# EasyEDA Pro project 辅助电源.epro, board PCB11
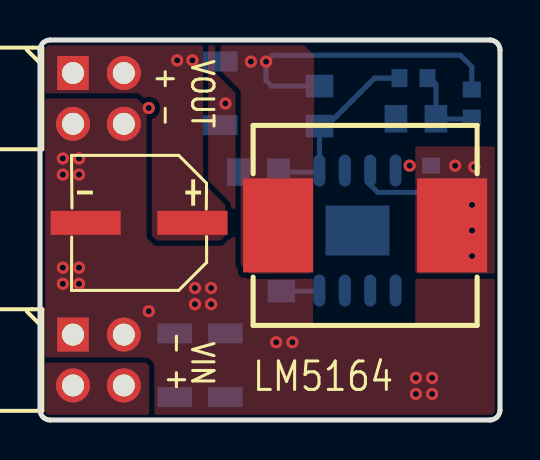
[diagram p3: board, top side]
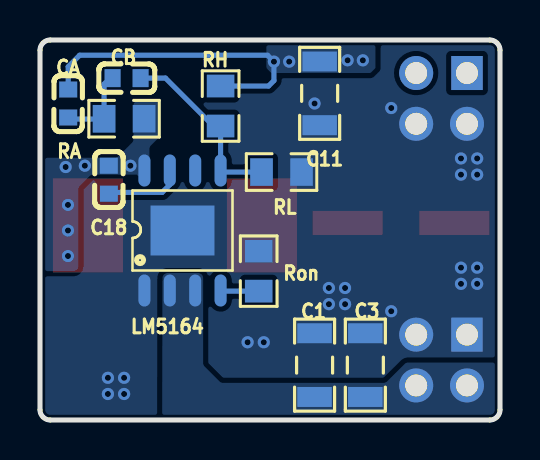
[diagram p4: board, bottom side, seen from below]

Outline 23 x 19 mm; copper layers: Top Layer, Bottom Layer. Coordinates in mm from the lower left corner of the outline.
Outline path: 0,18.49 0,0.51 arc(0.15,0.15) 0.51,0 22.49,0 arc(22.85,0.15) 23,0.51 23,18.49 arc(22.85,18.85) 22.49,19 0.51,19 arc(0.15,18.85) 0,18.49
Stack: Top Layer 0.035mm / Dielectric1 1.51mm FR4 er 4.5 / Bottom Layer 0.035mm

## Design rules (mm)
spacing copperThickness1oz (default): track to track 0.102, other pairs 0.152 to 0.3
spacing copperThickness2oz: track to track 0.203, other pairs 0.152 to 0.3
spacing Plane_innerPlane: track to track 0.102, other pairs 0.152 to 0.3
spacing Copper_copperRegion: track to track 0.102, other pairs 0.152 to 0.3
track width copperThickness1oz (default): min 0.127, default 0.254, max 2.54
track width copperThickness2oz: min 0.203, default 0.254, max 2.54
differential pair differentialPair (default): width min 0.127, default 0.254, max 2.54; gap min 0.152, default 0.152
net VOUT uses copperRegion_copperThickness1oz
pour e30 uses Copper_copperRegion, copperRegion_Copper_copperRegion
pour e32 uses Copper_copperRegion, copperRegion_Copper_copperRegion
pour e34 uses Copper_copperRegion, copperRegion_Copper_copperRegion
pour e36 uses Copper_copperRegion, copperRegion_Copper_copperRegion
pour e38 uses Copper_copperRegion, copperRegion_Copper_copperRegion
pour e106 uses Copper_copperRegion, copperRegion_Copper_copperRegion
pour e109 uses Copper_copperRegion, copperRegion_Copper_copperRegion
pour e113 uses Copper_copperRegion, copperRegion_Copper_copperRegion
pour e115 uses Copper_copperRegion, copperRegion_Copper_copperRegion

## Placement (name value [footprint] x y rotation side)
C1  10u  [C1206]  9.27 2.74 270 bottom
C2  47uF  [CAP-SMD_BD6.3-L6.6-W6.6-LS7.3-FD]  4.95 9.86 180 top
C3  100nf  [C1206]  6.73 2.74 270 bottom
C11  100nf  [C1206]  9.02 16.33 90 bottom
C18  2.2nF  [C0603]  19.56 12.02 270 bottom
CA  2.2nF  [C0603]  21.59 15.82 90 bottom
CB  10pF  [C0603]  18.67 17.09 0 bottom
J1  HX PZ2.54-2x2P WC-A  [HDR-TH_4P-P2.54-H-M-R2-C2-S2.54-W10.0]  2.92 3 270 top
J2  HX PZ2.54-2x2P WC-A  [HDR-TH_4P-P2.54-H-M-R2-C2-S2.54-W10.0]  2.92 16.08 270 top
LM5164  LM5164DDAR  [SO-8_L4.9-W3.9-P1.27-LS6.0-BL-EP]  15.88 9.47 180 bottom
RA  560K  [R0805]  18.8 15.06 180 bottom
RH  180K  [R0805]  13.97 15.7 90 bottom
RL  20K  [R0805]  10.92 12.4 0 bottom
Ron  100K  [R0805]  12.06 7.44 270 bottom
U1  47uH  [IND-SMD_L11.0-W10.2]  16.26 9.73 180 top

## Footprints (pads in the part's own frame, mm; a bottom-side part is the same pattern mirrored in y, then rotated)
C0603
  rect 0.8x0.9 smd: 1(-0.7,0) 2(0.7,0)
C1206
  rect 1x1.728 smd: 1(-1.593,0) 2(1.593,0)
CAP-SMD_BD6.3-L6.6-W6.6-LS7.3-FD
  rect 3.5x1.2 smd: 1(-2.67,0) 2(2.67,0)
HDR-TH_4P-P2.54-H-M-R2-C2-S2.54-W10.0
  rect 1.7x1.575 hole 1.1: 1(-1.27,-1.27)
  round 1.7 hole 1.1: 2(-1.27,1.27) 3(1.27,-1.27) 4(1.27,1.27)
IND-SMD_L11.0-W10.2
  rect 3.5x4.7 smd: 1(-4.35,0) 2(4.35,0)
R0805
  rect 1.133x1.377 smd: 1(-1,0) 2(1,0)
SO-8_L4.9-W3.9-P1.27-LS6.0-BL-EP
  oval 0.6x1.6 smd: 1(-1.905,-3) 2(-0.635,-3) 3(0.635,-3) 4(1.905,-3) 5(1.905,3) 6(0.635,3) 7(-0.635,3) 8(-1.905,3)
  rect 3.2x2.5 smd: 9(0,0)

## Nets
As in the schematic.

Pads without a net: LM5164 6

## Via types
v1: diameter 0.61, hole 0.305, Top Layer to Bottom Layer, 31 vias

## Routing (per net, layer and track width the routed paths; a pad name or vN(x,y) marks a point on that pad's centre or on a via; arc(x,y) is an arc through that point)
GND:
  vias: v1(1.14,13.08) v1(1.14,12.27) v1(1.14,7.62) v1(1.14,6.81) v1(1.95,13.08) v1(1.95,12.27) v1(1.95,7.62) v1(1.95,6.81) v1(5.44,15.6) v1(5.44,5.44) v1(7.75,6.6) v1(7.75,5.79) v1(8.56,6.6) v1(8.56,5.79) v1(9.27,15.82) v1(11.81,3.89) v1(12.62,3.89) v1(18.8,2.11) v1(18.8,1.3) v1(19.6,2.11) v1(19.6,1.3)
VOUT: length 15.5
  Bottom Layer w0.254: RH.2 11.57,16.7 11.3,16.97 v1(11.3,17.92) 11.62,18.24 21.02,18.24 21.59,17.66 CA.2
  vias: v1(6.86,17.98) v1(7.62,17.98) v1(10.54,17.92)
$1N503: length 1.9
  Bottom Layer w0.254: Ron.2 13.94,6.44 LM5164.4
$1N505: length 9.3
  Bottom Layer w0.254: RL.2 13.89,12.4 LM5164.5 RH.1 14.33,14.7 16.73,17.09 17.84,17.09 17.97,17.22
$1N506: length 3.9
  Bottom Layer w0.254: LM5164.7 16.51,11.76 16.89,11.38 19.49,11.38 C18.2
$1N507:
  vias: v1(18.48,12.71) v1(20.76,12.71) v1(21.6,10.75) v1(21.6,9.48) v1(21.6,8.2) v1(21.72,12.65)
$1N1696: length 4.1
  Bottom Layer w0.254: 21.55,15.05 19.81,15.05 RA.1 19.8,16.79 19.37,17.22

## Copper pours and planes (outline as drawn; the poured copper is in the pictures)
GND on Top Layer: -1.14,19.51 23.75,19.51 23.75,-0.94 -1.14,-0.94
GND on Bottom Layer: -1.02,19.51 23.88,19.51 23.88,-0.94 -1.02,-0.94
VIN on Top Layer: -0.59,2.62 -0.57,2.71 -0.52,2.8 -0.44,2.85 -0.34,2.87 5.21,2.87 5.3,2.85 5.39,2.8 5.44,2.71 5.46,2.62 5.46,-0.43 5.44,-0.53 5.39,-0.61 5.3,-0.67 5.21,-0.69 -0.34,-0.69 -0.44,-0.67 -0.52,-0.61 -0.57,-0.53 -0.59,-0.43
VOUT on Top Layer: 7.87,19.51 8.15,19.23 8.15,11.86 9.27,10.74 9.27,9.22 9.02,8.97 5.84,8.97 5.59,9.22 5.59,15.7 4.95,16.33 0.29,16.33 0,16.62 0,18.87 0.51,19.38 5.08,19.38 5.84,19.78 6.22,19.63 6.35,19.51
VOUT on Top Layer: 10.49,7.31 10.03,7.77 10.03,16.46 9.02,17.48 9.02,19.63 8.89,19.76 12.18,19.76 13.71,18.24 13.71,7.56 13.46,7.32
VOUT on Bottom Layer: 6.22,17.6 6.22,19.25 6.33,19.36 11.5,19.36 11.68,19.18 11.68,17.6 11.43,17.35 6.48,17.35
$1N507 on Bottom Layer: 17.78,11.89 17.6,11.96 17.53,12.14 17.53,13.55 17.51,13.65 17.45,13.73 17.11,14.07 17.05,14.15 17.03,14.25 17.03,15.84 17.17,15.98 18.07,15.98 18.25,15.91 18.32,15.73 18.32,14.04 18.34,13.95 18.4,13.86 19.08,13.18 19.16,13.13 19.26,13.11 22.85,13.11 23.03,13.04 23.11,12.86 23.11,7.7 23.03,7.52 22.85,7.44 21.34,7.44 21.16,7.52 21.08,7.7 21.08,11.53 21.06,11.63 21.01,11.71 20.52,12.19 20.44,12.25 20.34,12.27 18.16,12.27 18.03,12.14 18.03,11.89
VIN on Bottom Layer: -0.31,-0.51 -0.36,-0.42 -0.38,-0.33 -0.38,2.62 -0.31,2.8 -0.13,2.87 4.59,2.87 4.69,2.85 4.77,2.8 5.64,1.93 5.72,1.87 5.82,1.85 13.85,1.85 13.95,1.87 14.03,1.93 14.77,2.67 14.82,2.75 14.84,2.85 14.84,7.09 14.92,7.27 15.1,7.35 16.62,7.35 16.8,7.27 16.88,7.09 16.89,-0.69 17.02,-0.81 0.1,-0.81 0.01,-0.79 -0.07,-0.74
$1N507 on Top Layer: 19.05,7.32 18.69,7.46 18.54,7.82 18.54,11.8 18.5,12 18.39,12.16 18.06,12.5 17.95,12.67 17.91,12.86 17.91,13.17 18.06,13.53 18.41,13.68 23.48,13.68 23.75,13.41 23.75,7.82 23.6,7.46 23.24,7.32

## Text on the board
Top Silkscreen Layer: + - | VOUT | VIN | LM5164
